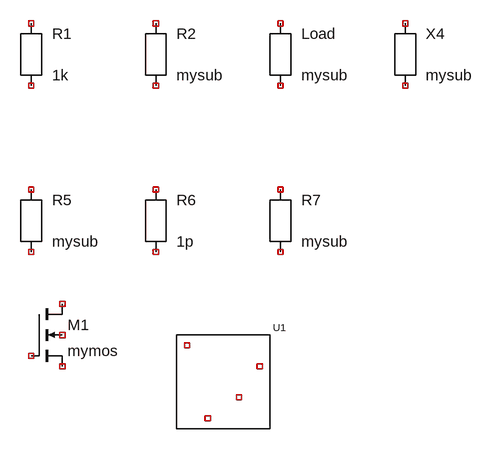
[diagram p0: schematic instance_prefix.asc]
instance_prefix.asc, the LTspice schematic file:
Version 4
SHEET 1 880 680
SYMBOL res 96 144 R0
SYMATTR InstName R1
SYMATTR Value 1k
SYMBOL res 288 144 R0
SYMATTR InstName R2
SYMATTR Prefix X
SYMATTR Value mysub
SYMBOL res 480 144 R0
SYMATTR InstName Load
SYMATTR Prefix X
SYMATTR Value mysub
SYMBOL res 672 144 R0
SYMATTR InstName X4
SYMATTR Prefix X
SYMATTR Value mysub
SYMBOL res 96 400 R0
SYMATTR InstName R5
SYMATTR Prefix x
SYMATTR Value mysub
SYMBOL res 288 400 R0
SYMATTR InstName R6
SYMATTR Prefix C
SYMATTR Value 1p
SYMBOL res 480 400 R0
SYMATTR Prefix X
SYMATTR InstName R7
SYMATTR Value mysub
SYMBOL nmos4 96 528 R0
SYMATTR InstName M1
SYMATTR Prefix X
SYMATTR Value mymos
SYMBOL cell4 400 640 R0
SYMATTR InstName U1
SYMATTR Prefix R
SYMATTR Value 5k

The netlist it stands for:
* instance_prefix.asc
R1 NC_01 NC_02 1k
XR2 NC_03 NC_04 mysub  ; pins 1 2
XLoad NC_05 NC_06 mysub  ; pins 1 2
XX4 NC_07 NC_08 mysub  ; pins 1 2
XR5 NC_09 NC_10 mysub  ; pins 1 2
C§R6 NC_11 NC_12 1p
XR7 NC_13 NC_14 mysub  ; pins 1 2
XM1 NC_15 NC_16 NC_17 NC_18 mymos  ; pins D G S B
R§U1 NC_19 NC_20 NC_21 NC_22 5k
.backanno
.end